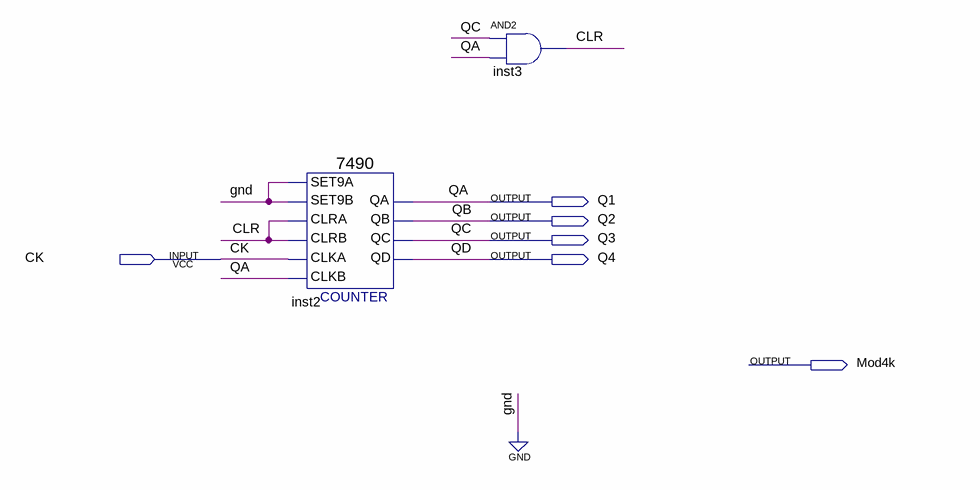
[diagram p0: schematic sheet]
// Quartus schematic FPGA_Mod4.bdf as structural Verilog: 2 symbols, 6 pins
module FPGA_Mod4 (
  input  CK,
  output Q1,
  output Q2,
  output Q3,
  output Q4,
  output Mod4k
);

  wire CLR;

  \7490  inst2 (
    .SET9A(1'b0), .CLRA(CLR), .SET9B(1'b0), .CLKB(Q1), .CLKA(CK), .CLRB(CLR), .QD(Q4), .QA(Q1), .QB(Q2),
    .QC(Q3));
  and inst3 (CLR, Q3, Q1);

  // Other names for the same wires on the sheet: QA = Q1; QB = Q2; QC = Q3; QD = Q4
endmodule
